# EAGLE design Arduino Loconet-DCC v2 Expansion Adapter (EAGLE 9.6.2)
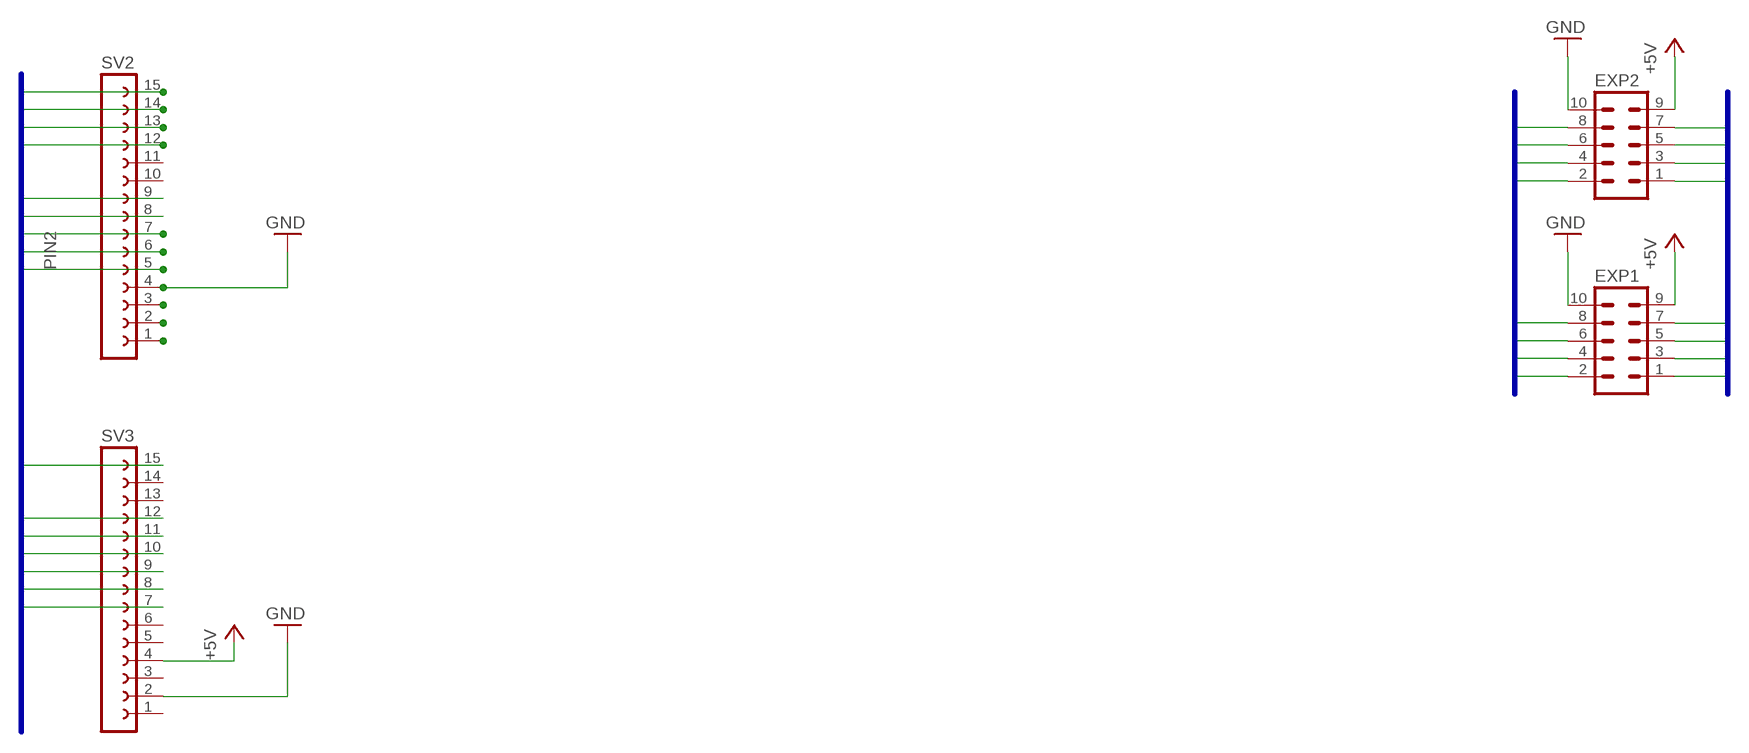
[diagram p0: schematic, sheet 1]

## Parts
EXP1  ML10  [ML10]
EXP2  ML10  [ML10]
SV2  FE15-1NOTEXT  [FE15]
SV3  FE15-1NOTEXT  [FE15]

## Nets
+5V [5v]: EXP1.9 EXP2.9 SV3.4
A0: EXP2.3 SV3.12
A1: EXP2.4 SV3.11
A2: EXP2.5 SV3.10
A3: EXP2.6 SV3.9
GND [ground]: EXP1.10 EXP2.10 SV2.4 SV3.2
PIN2: EXP1.1 SV2.5
PIN3: EXP1.2 SV2.6
PIN4: EXP1.3 SV2.7
PIN5: EXP1.4 SV2.8
PIN6: EXP1.5 SV2.9
PIN9: EXP1.6 SV2.12
PIN10: EXP1.7 SV2.13
PIN11: EXP1.8 SV2.14
PIN12: EXP2.1 SV2.15
PIN13: EXP2.2 SV3.15
RESET: SV2.3
RXD: SV2.2
SCL: EXP2.8 SV3.7
SDA: EXP2.7 SV3.8
TXD: SV2.1
Unconnected: SV2.10 SV2.11 SV3.1 SV3.3 SV3.5 SV3.6 SV3.13 SV3.14

## Buses
EXPANSION:A0,A1,A2,A3,PIN2,PIN3,PIN4,PIN5,PIN6,PIN9,PIN10,PIN11,PIN12,PIN13,SCL,SDA

## Library data of the parts
EXP1 EXP2 = con-ml:ML10: HARTING; OC_FARNELL: unknown; OC_NEWARK: unknown
SV2 SV3 = con-lsta:FE15-1: FEMALE HEADER

## Net classes
0 default: width 0.254 mm
1 ground: width 0.61 mm
2 5v: width 0.508 mm
3 Vin: width 0.61 mm
4 Loconet: width 0.508 mm
5 DCC: width 0.508 mm

## Board
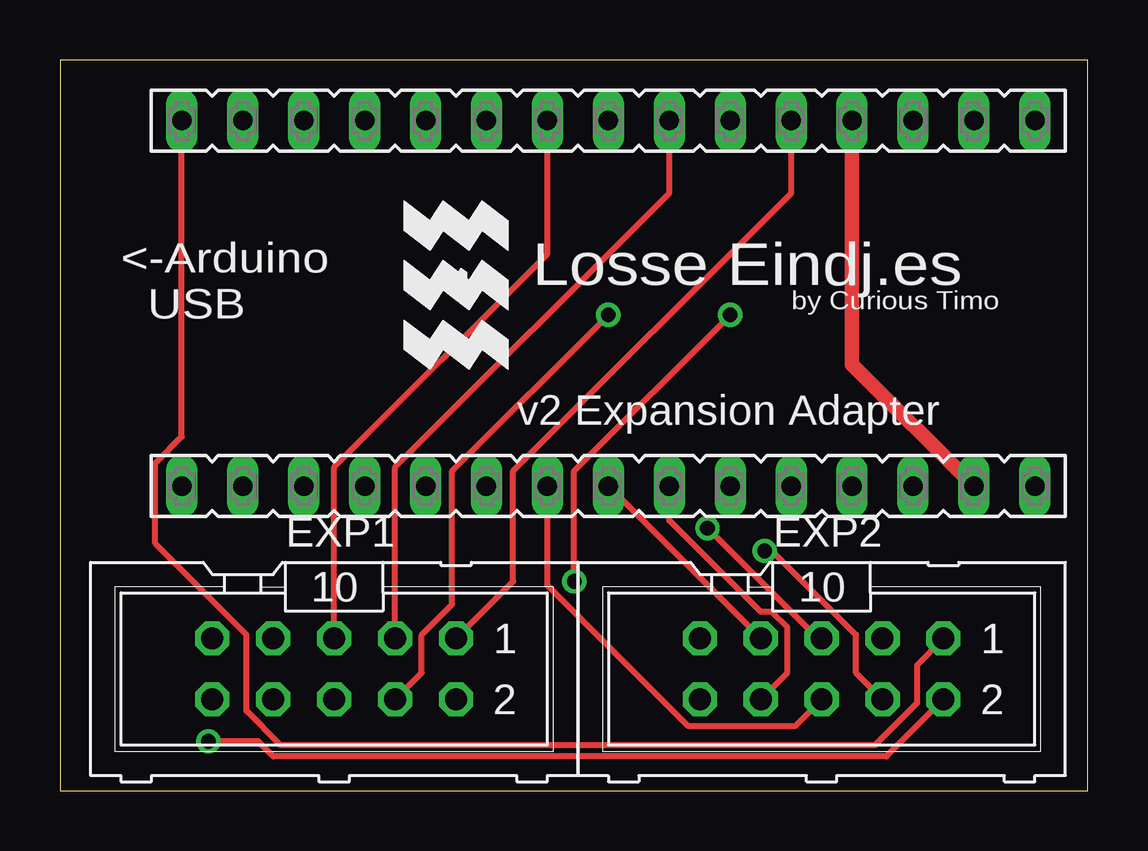
[diagram p1: board, top side]
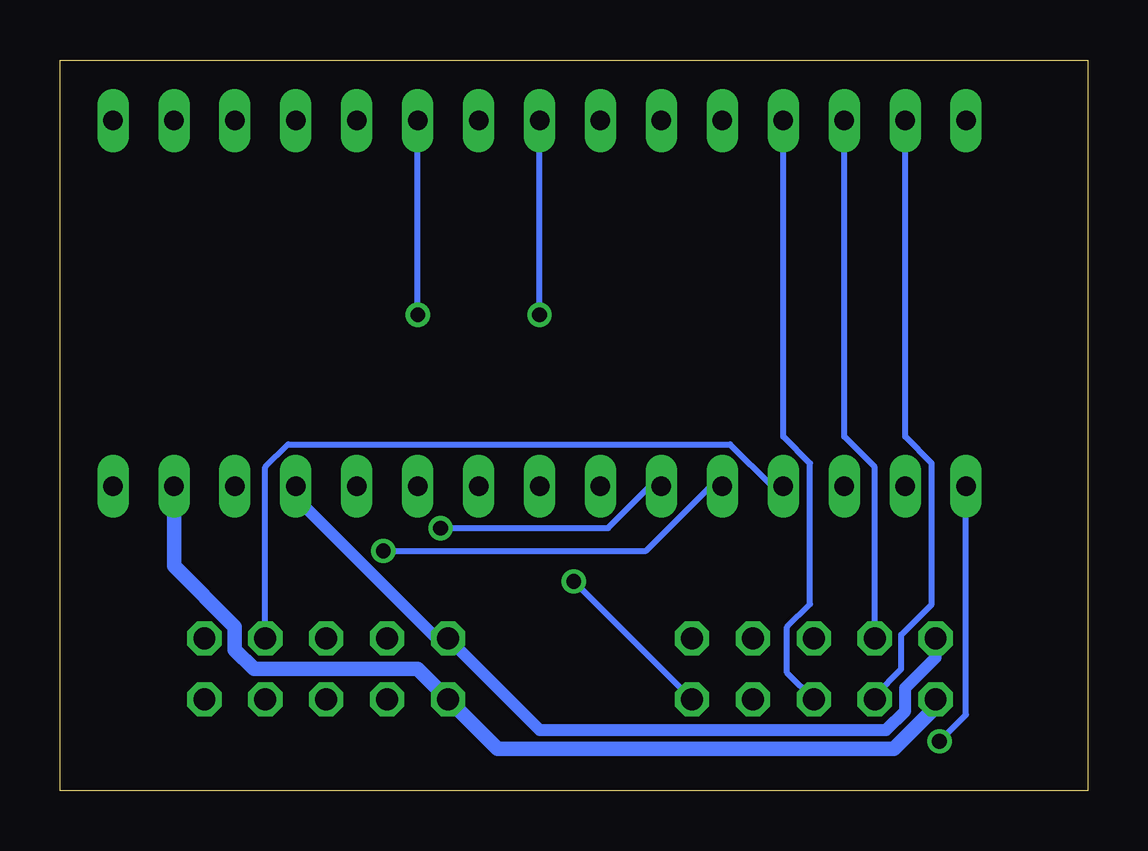
[diagram p2: board, bottom side, seen from below]

Size 42.85 x 30.47 mm. Coordinates in mm from the lower left corner, seen from the top.
Outline: 0,0 42.85,0 42.85,30.47 0,30.47 0,0
Copper layers (1*16): Top 0.035mm / dielectric 1.5mm / Bottom 0.035mm
Design rules "default": minimum track width 10mil, minimum drill 24mil, track to track 8mil, track to pad 8mil, pad to pad 8mil, via to via 8mil, smd to smd 8mil, copper to edge 40mil, drill to drill 8mil, minimum pad ring 10mil, minimum via ring 8mil, stop-mask expansion 4mil, vias tented up to drill 0mil, thermal gap 10mil

### Footprints (pad centres in the part's own frame; a part is rotated, then mirrored left to right if it is on the bottom)
ML10 = drill 0.914 octagon: 1 -5.08,-1.27; 2 -5.08,1.27; 3 -2.54,-1.27; 4 -2.54,1.27; 5 0,-1.27; 6 0,1.27; 7 2.54,-1.27; 8 2.54,1.27; 9 5.08,-1.27; 10 5.08,1.27
FE15 = drill 0.813 long: 1 -17.78,0; 2 -15.24,0; 3 -12.7,0; 4 -10.16,0; 5 -7.62,0; 6 -5.08,0; 7 -2.54,0; 8 0,0; 9 2.54,0; 10 5.08,0; 11 7.62,0; 12 10.16,0; 13 12.7,0; 14 15.24,0; 15 17.78,0

### Placement (x,y rotation side)
EXP1  11.43,5.08 180 top
EXP2  31.75,5.08 180 top
SV2  22.86,27.94 180 top
SV3  22.86,12.7 180 top

### Tracks (layer width: path | path; a pad name or v marks a point on that pad's centre or on a via)
+5V
  Bottom 0.508: SV3.4 33.02,12.22 27.15,6.35 EXP2.9 22.86,2.54 8.41,2.54 7.62,3.33 7.62,4.29 6.35,5.56 EXP1.9
A0
  Bottom 0.254: SV3.12 13.18,12.7 14.92,14.45 33.34,14.45 34.29,13.49 EXP2.3
A1  (via drill 0.61)
  Top 0.254: v29.37,10 29.69,10 33.18,6.51 33.18,4.92 EXP2.4
  Bottom 0.254: SV3.11 15.72,12.7 18.41,10 v29.37,10
A2  (via drill 0.61)
  Top 0.254: v26.99,10.95 31.59,6.35 EXP2.5
  Bottom 0.254: SV3.10 18.26,12.7 20,10.95 v26.99,10.95
A3
  Top 0.254: SV3.9 20.32,8.57 26.19,2.7 30.64,2.7 EXP2.6
GND
  Top 0.61: SV2.4 33.02,17.78 SV3.2
  Bottom 0.61: EXP1.10 6.35,3.49 8.1,1.75 24.61,1.75 EXP2.10 27.94,5.08 34.77,5.08 35.56,5.87 35.56,6.83 38.1,9.37 SV3.2
PIN2
  Top 0.254: SV2.5 30.48,24.92 18.89,13.34 18.89,8.73 EXP1.1
PIN3  (via drill 0.61)
  Top 0.254: v27.94,19.84 21.43,13.34 v21.43,8.73
  Bottom 0.254: v27.94,19.84 SV2.6 | EXP1.2 v21.43,8.73
PIN4
  Top 0.254: SV2.7 25.4,24.92 13.97,13.49 EXP1.3
PIN5  (via drill 0.61)
  Top 0.254: v22.86,19.84 16.35,13.34 16.35,7.78 15.08,6.51 15.08,4.92 EXP1.4
  Bottom 0.254: v22.86,19.84 SV2.8
PIN6
  Top 0.254: SV2.9 20.32,22.38 11.43,13.49 EXP1.5
PIN9
  Bottom 0.254: SV2.12 12.7,14.76 11.59,13.65 11.59,7.78 12.54,6.83 12.54,4.92 EXP1.6
PIN10
  Bottom 0.254: SV2.13 10.16,14.76 8.89,13.49 EXP1.7
PIN11
  Bottom 0.254: SV2.14 7.62,14.76 6.51,13.65 6.51,7.78 7.78,6.51 7.78,5.08 8.89,3.97 EXP1.8
PIN12
  Top 0.254: SV2.15 5.08,14.76 3.97,13.65 3.97,10.32 7.78,6.51 7.78,3.33 9.21,1.91 33.97,1.91 35.72,3.65 35.72,5.24 EXP2.1
PIN13  (via drill 0.61)
  Top 0.254: v6.19,2.06 8.26,2.06 8.89,1.43 34.45,1.43 EXP2.2
  Bottom 0.254: SV3.15 5.08,3.17 v6.19,2.06
SCL
  Top 0.254: SV3.7 25.4,11.27 29.21,7.46 29.69,7.46 30.32,6.83 30.32,4.92 EXP2.8
SDA
  Top 0.254: EXP2.7 SV3.8

### Text on the board
tPlace: by Curious Timo | v2 Expansion Adapter
tNames: Losse Eindj.es | <-Arduino / USB